# Altium schematic sheet RTC.SchDoc
size A4; SheetNumber: 16; SheetTotal: 16
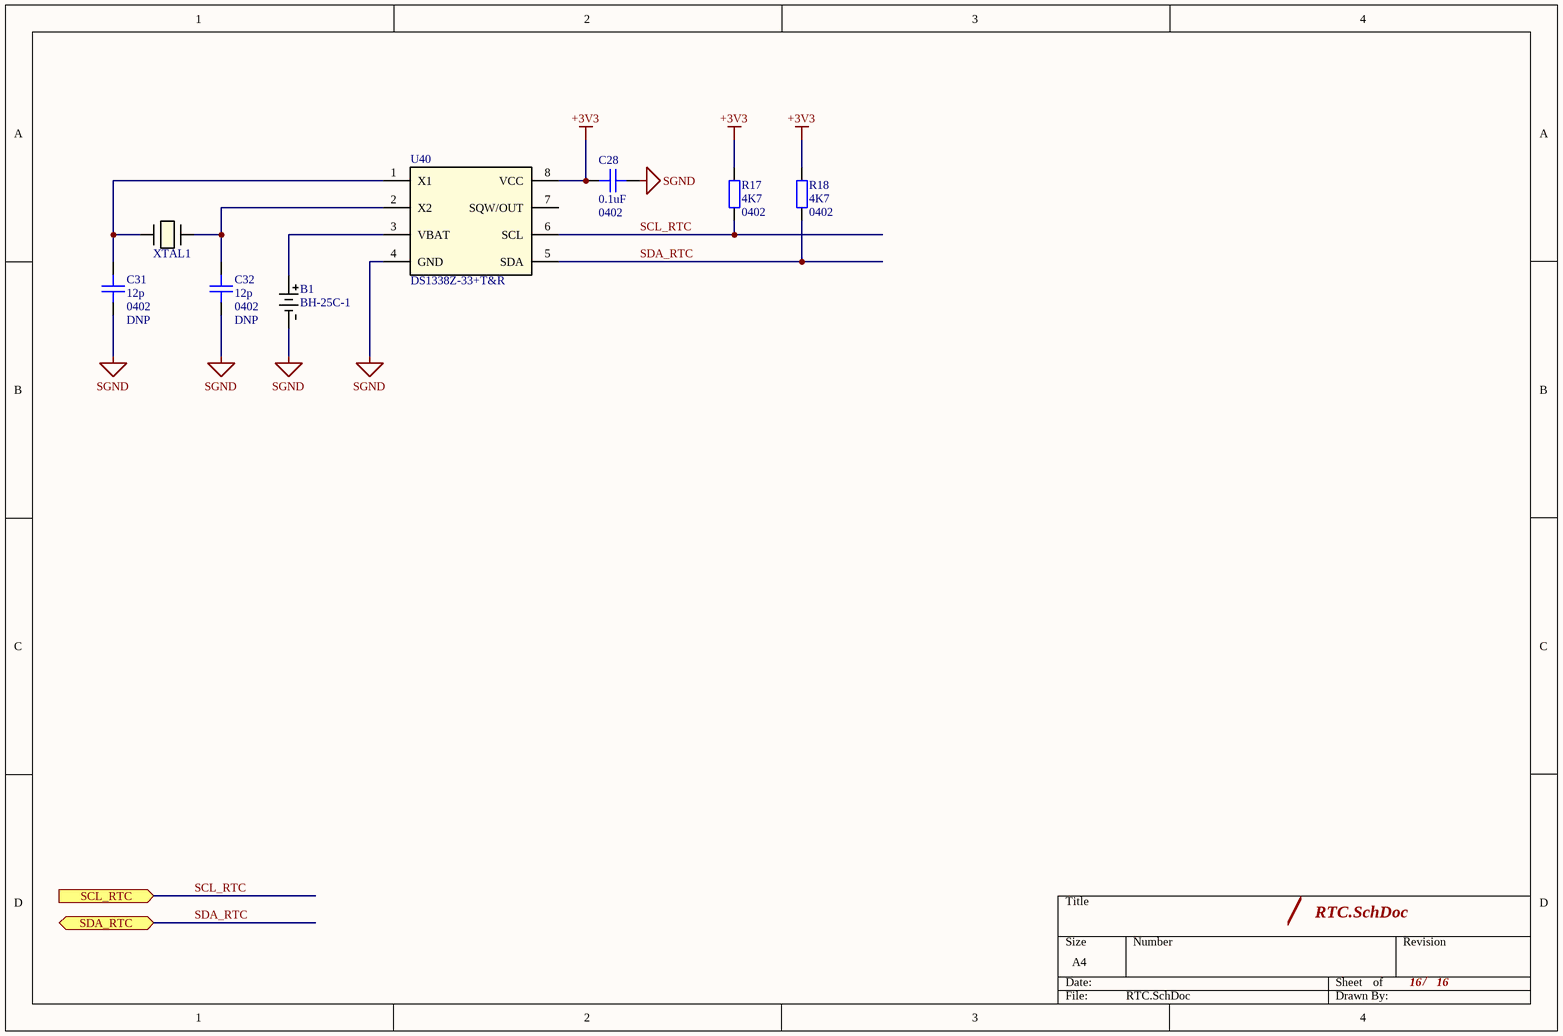
[diagram p0: RTC.SchDoc]

## Parts
B1  BH-25C-1  [BH-25C-1_ADM]
C28  Capacitance: 0.1uF  Package1: 0402  [CAPC100x50x50L25]  (hidden comment: 04023C104KAT2A)
C31  Capacitance: 12p  Package1: 0402  [CAPC100x50x50L25]  (hidden comment: CBR04C120F5GAC)
C32  Capacitance: 12p  Package1: 0402  [CAPC100x50x50L25]  (hidden comment: CBR04C120F5GAC)
R17  Resistance: 4K7  Package2: 0402  [RESC100X50X40L25]  (hidden comment: RC0402FR-074K7L)
R18  Resistance: 4K7  Package2: 0402  [RESC100X50X40L25]  (hidden comment: RC0402FR-074K7L)
U40  DS1338Z-33+T&R  [SOIC8P127_490X600X175L70X41]
XTAL1  FC2012AN 32.768K-90NN60KD7  [XTAL_FC2012AN_EPS]  (value not drawn)

## Ports
SCL_RTC (in), SDA_RTC (bidir)

## Nets
+3V3: C28.2 R17.2 R18.2 U40.8(VCC)
SGND: B1.1 C28.1 C31.1 C32.1 U40.4(GND)
SCL_RTC: R17.1 U40.6(SCL) ; port SCL_RTC
SDA_RTC: R18.1 U40.5(SDA) ; port SDA_RTC
NetB1_2: B1.2 U40.3(VBAT)
NetC31_2: C31.2 U40.1(X1) XTAL1.1
NetC32_2: C32.2 U40.2(X2) XTAL1.2

Not connected (* = marked no-connect by the designer): U40 7(SQW/OUT)

## Notes on the sheet
- /

## Library data of the parts
B1 = BH-25C-1: BATT HLDR COIN 20MM 1 CEL PC PIN; Mfr_Name: ADAM TECHNOLOGIES INC; Battery Series: 2032; MPN: BH-25C-1; DigiKey_URL: https://www.digikey.bg/en/products/detail/adam-tech/BH-25E-1/13537715; Datasheet_URL: https://app.adam-tech.com/products/download/data_sheet/196965/bh-25e-1-data-sheet.pdf
C28 = CMP-001-0374-4: 0402 25V X7R 100 NF 10%; Manufacturer: KYOCERA AVX; Op Temp max: 85°C; Op Temp min: -55°C; ComponentLink3URL: https://www.digikey.com/en/products/detail/yageo/CC0402MRX5R5BB106/5195138; MPN: 04023C104KAT2A; ComponentLink1URL: https://www.yageo.com/upload/media/product/productsearch/datasheet/mlcc/UPY-GPHC_X5R_4V-to-50V_26.pdf; Package: 0402 (1005 Metric); Size: 1.00mm x 0.50mm; Height max: 700µm; Mounting Type: SM; Tolerance: 10%; ComponentLink1Description: Datasheet; ComponentLink3Description: Digikey; Ratings: -; Dielectric: X7R; ComponentLink2Description: Mouser; ComponentLink2URL: https://eu.mouser.com/ProductDetail/YAGEO/CC0402MRX5R5BB106?qs=zEY9bCHj09eCmUJdZuS5Lg%3D%3D; Lead Spacing: 0mm; Component Type: Ceramic Capacitor; Voltage Rating: 25V
C31 C32 = CMP-001-0374-4: CAP CER 12PF 50V C0G/NP0 0402; Manufacturer: KEMET; Op Temp max: 55°C; Op Temp min: -125°C; Tolerance: ±1%; Dielectric: C0G, NP0; MPN: CBR04C120F5GAC; Package: 0402 (1005 Metric); Size: 1.00mm x 0.50mm; Height max: 700µm; Mounting Type: SM; ComponentLink1Description: Datasheet; ComponentLink3Description: Digikey; Ratings: -; Lead Spacing: 0mm; Component Type: Ceramic Capacitor; Voltage Rating: 50V; DNP: DNP
  C31: ComponentLink3URL: https://www.digikey.ee/en/products/detail/kemet/CBR04C949B5GAC/7649438?s=N4IgTCBcDaIMICEBKAGALHAnGzCCsA4gIJwgC6AvkA; ComponentLink1URL: https://connect.kemet.com:7667/gateway/IntelliData-ComponentDocumentation/1.0/download/datasheet/CBR04C120F5GAC
  C32: ComponentLink3URL: https://www.digikey.com/en/products/detail/yageo/CC0402MRX5R5BB106/5195138; ComponentLink1URL: https://www.yageo.com/upload/media/product/productsearch/datasheet/mlcc/UPY-GPHC_X5R_4V-to-50V_26.pdf; ComponentLink2Description: Mouser; ComponentLink2URL: https://eu.mouser.com/ProductDetail/YAGEO/CC0402MRX5R5BB106?qs=zEY9bCHj09eCmUJdZuS5Lg%3D%3D
R17 R18 = CMP-001-0484-6: RES 4K7 OHM 1% 1/16W 0402; Manufacturer: YAGEO; Power: 63mW; Op Temp min: -55°C; Temperature Coefficient: ±100ppm; Op Temp max: 155°C; ComponentLink3URL: https://www.digikey.com/en/products/detail/yageo/RC0402FR-0727RL/5280946; ComponentLink2Description: Mouser; Ratings: -; Tolerance: 1%; Height max: 400µm; MPN: RC0402FR-074K7L; ComponentLink1URL: https://www.yageo.com/upload/media/product/productsearch/datasheet/rchip/PYu-RC_Group_51_RoHS_L_12.pdf; Size: 1.00mm x 0.50mm; Composition: Thick Film; Package: 0402 (1005 Metric); ComponentLink3Description: Digikey; Mounting Type: SM; ComponentLink2URL: https://eu.mouser.com/ProductDetail/YAGEO/RC0402FR-0727RL?qs=UOUeRUa%252B8Wlb37UyFHw9Bw%3D%3D; ComponentLink1Description: Datasheet; Component Type: Chip Resistor
U40 = DS1338Z-33+TR: IC RTC CLK/CALENDAR I2C 8SOIC; Voltage - Supply: 3V ~ 5.5V; Voltage - Supply, Battery: 1.3V ~ 3.7V; MFN: DS1338Z-33+T&R; ComponentLink1Description: Datasheet; ComponentLink1URL: https://www.analog.com/media/en/technical-documentation/data-sheets/DS1338-DS1338Z.pdf; Package: SOIC-8; ComponentLink2Description: DigiKey; ComponentLink2URL: https://www.digikey.ee/en/products/detail/analog-devices-inc-maxim-integrated/DS1338Z-33-T-R/1196924; Operating Temperature MAX: + 85°C; Operating Temperature MIN: -40°C
XTAL1 = FC2012AN 32.768K-90NN60KD7: CRYSTAL 32.7680KHZ 9PF SMD; Mfr_Name: Epson; Frequency: 32.768 kHz; MPN: FC2012AN 32.768K-90NN60KD7